# Altium schematic sheet CAN_LIN.SchDoc
size A4; SheetNumber: 3; SheetTotal: 3
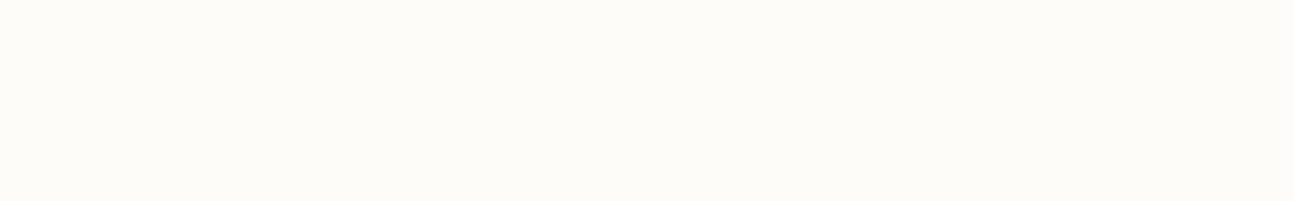
[diagram p0: CAN_LIN.SchDoc, left]
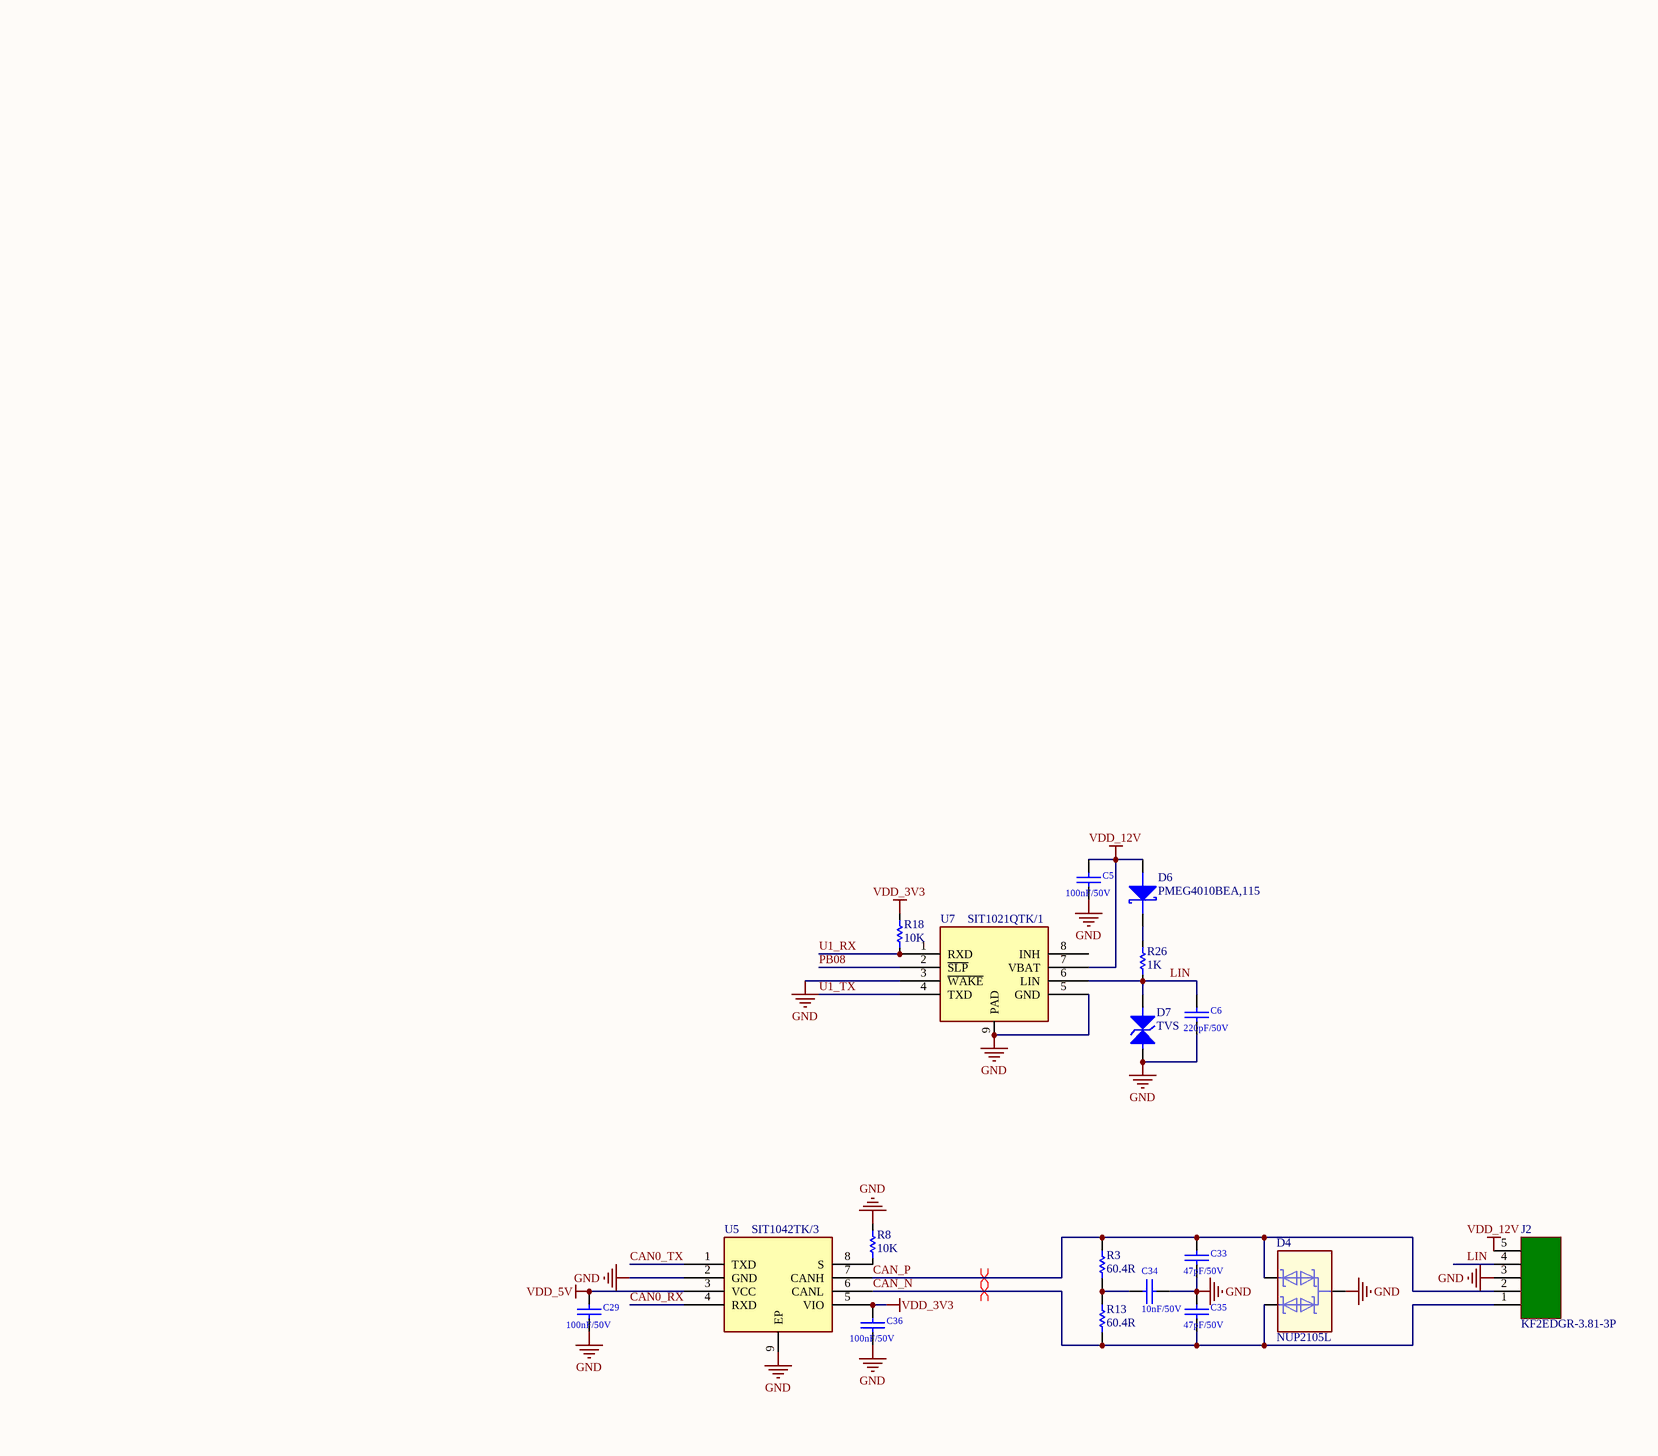
[diagram p1: CAN_LIN.SchDoc, right]

## Parts
C5  100nF/50V  [C0402]
C6  220pF/50V  [C0402]
C29  100nF/50V  [C0402]
C33  47pF/50V  [C0402]
C34  10nF/50V  [C0402]
C35  47pF/50V  [C0402]
C36  100nF/50V  [C0402]
D4  NUP2105L  [SOT-23]
D6  PMEG4010BEA,115  [SOD-323]
D7  TVS  [SOD-323 TVS]
J2  KF2EDGR-3.81-3P  [KF2EDGR-3.81-5P]
R3  60.4R  [R0603]
R8  10K  [R0402]
R13  60.4R  [R0603]
R18  10K  [R0402]
R26  1K  [R0805]
U5  SIT1042TK/3  [HVSON-8-EP(3x3)]
U7  SIT1021QTK/1  [HVSON-8-EP(3X3)]

## Nets
GND: C5.2 C6.1 C29.2 C33.1 C34.1 C35.2 C36.2 D4.3 D7.1 J2.3 R8.1 U5.2(GND) U5.9(EP) U7.3(~{WAKE}) U7.5(GND) U7.9(PAD)
VDD_3V3: C36.1 R18.1 U5.5(VIO)
VDD_5V: C29.1 U5.3(VCC)
VDD_12V: C5.1 D6.A J2.5 U7.7(VBAT)
CAN0_RX: U5.4(RXD)
CAN0_TX: U5.1(TXD)
CAN_N: C35.1 D4.2 J2.1 R13.2 U5.6(CANL)
CAN_P: C33.2 D4.1 J2.2 R3.1 U5.7(CANH)
LIN: C6.2 D7.2 J2.4 R26.2 U7.6(LIN)
PB08: U7.2(~{SLP})
U1_RX: R18.2 U7.1(RXD)
U1_TX: U7.4(TXD)
NetC34_2: C34.2 R3.2 R13.1
NetD6_K: D6.K R26.1
NetR8_2: R8.2 U5.8(S)

Not connected (* = marked no-connect by the designer): U7 8(INH)

## Layout directives
differential pair: CAN_N, CAN_P

## Library data of the parts
C5 C29 = Cap: Capacitor; Manufacturer: SAMSUNG(三星); PreferredModel: CL05B104KB54PNC; Name: Capacitance; WeldingType: SMD; JLC-Code: C307331
C6 = Cap: Capacitor; Manufacturer: Murata; PreferredModel: GCM155R71H221KA37D; Name: Capacitance; WeldingType: SMD; InternalNumbering: GRD1205; JCL-Code: C388904
C33 C35 = Cap: Capacitor; Manufacturer: Murata; PreferredModel: GCM1555C1H470JA16D; Name: Capacitance; WeldingType: SMD; JLC-Code: C126511
C34 = Cap: Capacitor; Manufacturer: Murata; PreferredModel: GCM155R71H103KA55D; Name: Capacitance; WeldingType: SMD; JLC-Code: C91601
C36 = Cap: Capacitor; Manufacturer: Murata; PreferredModel: GCM155R71H104KE02D; Name: Capacitance; WeldingType: SMD; InternalNumbering: GRD1123; JLC-Code: C85858
D4 = NUP2105L: TVS; Manufacturer: TECH PUBLIC(台舟); PreferredModel: NUP2105LT1G; WeldingType: SMD; Name: TVS; InternalNumbering: *; JLC-Code: C2890118
D6 = Schottky Diode: Manufacturer: Nexperia; WeldingType: SMD; PreferredModel: PMEG4010BEA,115; Name: Schottky Diode; InternalNumbering: *; JLC-Code: C36975
D7 = TVS: WeldingType: SMD; PreferredModel: *; Name: TVS; Manufacturer: *; InternalNumbering: *; JLC-Code: *
J2 = KF2EDGR-3.81-5P: Manufacturer: KEFA; PreferredModel: KF2EDGR-3.81-5P; Name: KF2EDGR-3.81-5P; WeldingType: *; JLC-Code: *
R3 = Res: Resistance; Manufacturer: YAGEO; PreferredModel: AC0603FR-0760R4L; WeldingType: SMD; InternalNumbering: GRD1496; Name: Resistance; JLC-Code: C144807
R8 R18 R26 = Res: Resistance; WeldingType: SMD; Name: Resistance; JLC-Code: *
R13 = Res: Resistance; Manufacturer: YAGEO; PreferredModel: AC0603FR-0760R4L; WeldingType: SMD; Name: Resistance; JLC-Code: C144807
U5 = SIT1042TK/3: 5M CAN FD/-40~125℃/AEC-Q100; Manufacturer: SIT; Name: CAN Transceiver; WeldingType: SMD; PreferredModel: SIT1042TK/3; JLC-Code: C38695
U7 = SIT1021QTK/1: 12V LIN/-40~150℃/AEC-Q100; Manufacturer: SIT(芯力特); Name: LIN Transceiver; WeldingType: SMD; PreferredModel: SIT1021QTK/1